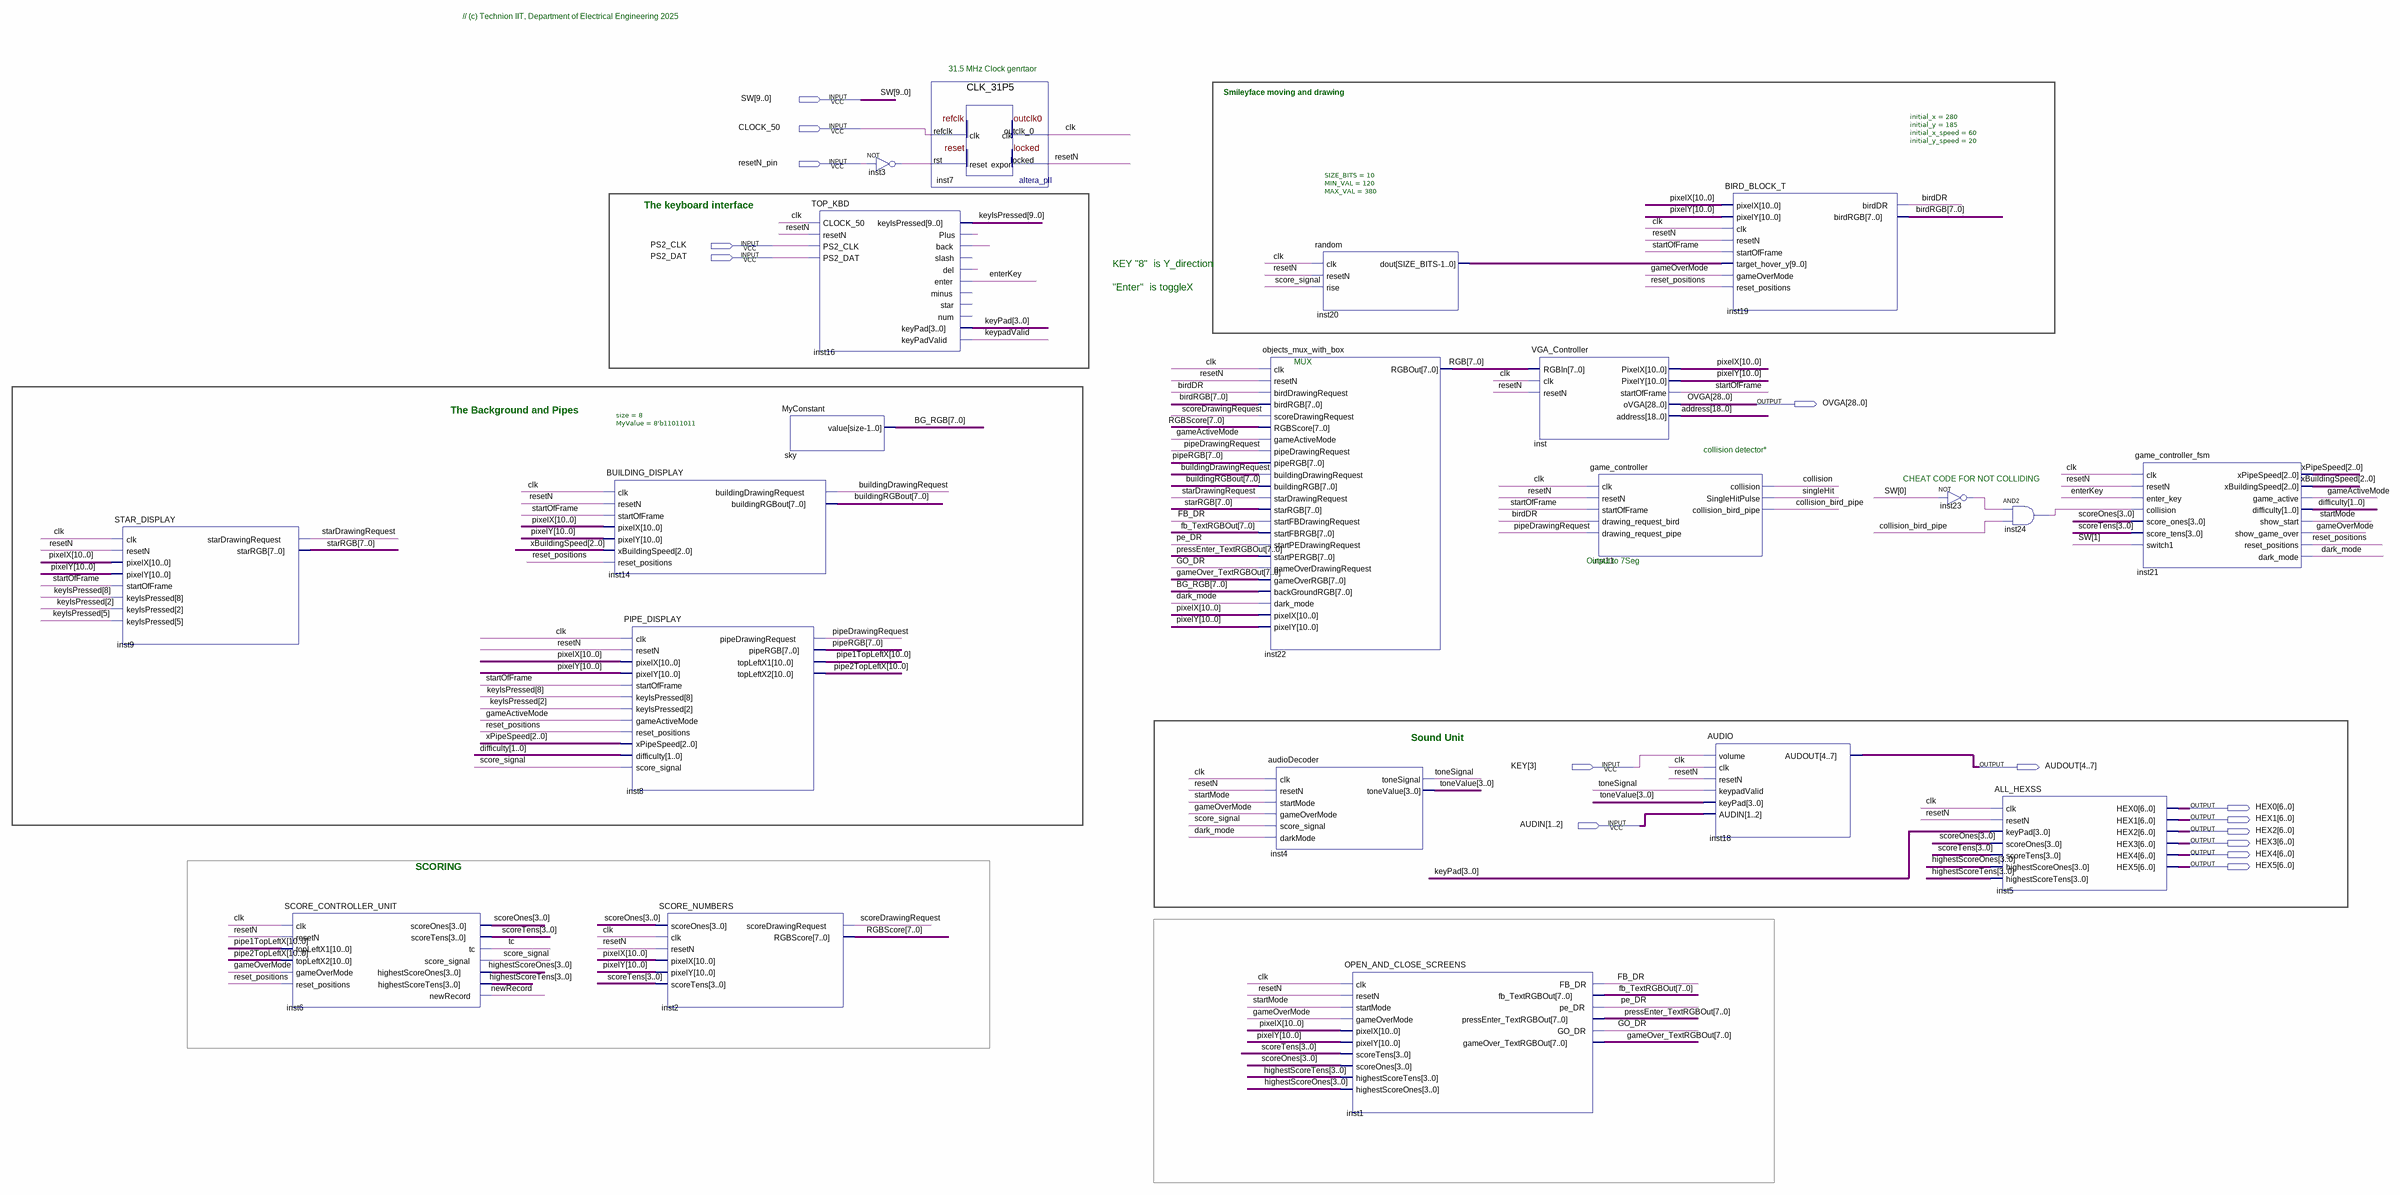
[diagram p0: schematic sheet]
// Quartus schematic TOP_VGA_DEMO.bdf as structural Verilog: 21 symbols, 15 pins
module TOP_VGA_DEMO (
  input  [9:0] SW,
  input  CLOCK_50,
  input  resetN_pin,
  input  PS2_CLK,
  input  PS2_DAT,
  input  [3:3] KEY,
  input  [1:2] AUDIN,
  output [28:0] OVGA,
  output [4:7] AUDOUT,
  output [6:0] HEX0,
  output [6:0] HEX1,
  output [6:0] HEX2,
  output [6:0] HEX3,
  output [6:0] HEX4,
  output [6:0] HEX5
);

  wire birdDR, buildingDrawingRequest, clk, collision, collision_bird_pipe, dark_mode, enterKey, FB_DR,
       gameActiveMode, gameOverMode, GO_DR, inst3_out, inst16_back, inst16_del, inst16_plus, inst23_out,
       inst24_out, keypadValid, newRecord, pe_DR, pipeDrawingRequest, reset_positions, resetN, score_signal,
       scoreDrawingRequest, singleHit, starDrawingRequest, startMode, startOfFrame, tc, toneSignal;
  wire [1:0] difficulty;
  wire [2:0] xBuildingSpeed, xPipeSpeed;
  wire [3:0] highestScoreOnes, highestScoreTens, keyPad, scoreOnes, scoreTens, toneValue;
  wire [7:0] BG_RGB, birdRGB, buildingRGBout, fb_TextRGBOut, gameOver_TextRGBOut, pipeRGB,
       pressEnter_TextRGBOut, RGB, RGBScore, starRGB;
  wire [9:0] inst20_dout, keyIsPressed;
  wire [10:0] pipe1TopLeftX, pipe2TopLeftX, pixelX, pixelY;
  wire [18:0] address;

  STAR_DISPLAY inst9 (
    .clk(clk), .resetN(resetN), .pixelX(pixelX), .pixelY(pixelY), .startOfFrame(startOfFrame),
    .keyIsPressed({keyIsPressed[8], keyIsPressed[5], keyIsPressed[2]}),
    .starDrawingRequest(starDrawingRequest), .starRGB(starRGB));
  SCORE_CONTROLLER_UNIT inst6 (
    .clk(clk), .resetN(resetN), .topLeftX1(pipe1TopLeftX), .topLeftX2(pipe2TopLeftX),
    .gameOverMode(gameOverMode), .reset_positions(reset_positions), .scoreOnes(scoreOnes),
    .scoreTens(scoreTens), .tc(tc), .score_signal(score_signal), .highestScoreOnes(highestScoreOnes),
    .highestScoreTens(highestScoreTens), .newRecord(newRecord));
  BUILDING_DISPLAY inst14 (
    .clk(clk), .resetN(resetN), .startOfFrame(startOfFrame), .pixelX(pixelX), .pixelY(pixelY),
    .xBuildingSpeed(xBuildingSpeed), .reset_positions(reset_positions),
    .buildingDrawingRequest(buildingDrawingRequest), .buildingRGBout(buildingRGBout));
  PIPE_DISPLAY inst8 (
    .clk(clk), .resetN(resetN), .pixelX(pixelX), .pixelY(pixelY), .startOfFrame(startOfFrame),
    .keyIsPressed({keyIsPressed[8], keyIsPressed[2]}), .gameActiveMode(gameActiveMode),
    .reset_positions(reset_positions), .xPipeSpeed(xPipeSpeed), .difficulty(difficulty),
    .score_signal(score_signal), .pipeDrawingRequest(pipeDrawingRequest), .pipeRGB(pipeRGB),
    .topLeftX1(pipe1TopLeftX), .topLeftX2(pipe2TopLeftX));
  SCORE_NUMBERS inst2 (
    .scoreOnes(scoreOnes), .clk(clk), .resetN(resetN), .pixelX(pixelX), .pixelY(pixelY),
    .scoreTens(scoreTens), .scoreDrawingRequest(scoreDrawingRequest), .RGBScore(RGBScore));
  MyConstant #(.size(8), .MyValue(8'b11011011)) sky (.value(BG_RGB));
  TOP_KBD inst16 (
    .CLOCK_50(clk), .resetN(resetN), .PS2_CLK(PS2_CLK), .PS2_DAT(PS2_DAT), .keyIsPressed(keyIsPressed),
    .Plus(inst16_plus), .back(inst16_back), .del(inst16_del), .enter(enterKey), .keyPad(keyPad),
    .keyPadValid(keypadValid));  // open: slash, minus, star, num
  not inst3 (inst3_out, resetN_pin);
  CLK_31P5 inst7 (.refclk(CLOCK_50), .rst(inst3_out), .outclk_0(clk), .locked(resetN));
  objects_mux_with_box inst22 (
    .clk(clk), .resetN(resetN), .birdDrawingRequest(birdDR), .birdRGB(birdRGB),
    .scoreDrawingRequest(scoreDrawingRequest), .RGBScore(RGBScore), .gameActiveMode(gameActiveMode),
    .pipeDrawingRequest(pipeDrawingRequest), .pipeRGB(pipeRGB),
    .buildingDrawingRequest(buildingDrawingRequest), .buildingRGB(buildingRGBout),
    .starDrawingRequest(starDrawingRequest), .starRGB(starRGB), .startFBDrawingRequest(FB_DR),
    .startFBRGB(fb_TextRGBOut), .startPEDrawingRequest(pe_DR), .startPERGB(pressEnter_TextRGBOut),
    .gameOverDrawingRequest(GO_DR), .gameOverRGB(gameOver_TextRGBOut), .backGroundRGB(BG_RGB),
    .dark_mode(dark_mode), .pixelX(pixelX), .pixelY(pixelY), .RGBOut(RGB));
  audioDecoder inst4 (
    .clk(clk), .resetN(resetN), .startMode(startMode), .gameOverMode(gameOverMode),
    .score_signal(score_signal), .darkMode(dark_mode), .toneSignal(toneSignal), .toneValue(toneValue));
  random #(.SIZE_BITS(10), .MIN_VAL(120), .MAX_VAL(380)) inst20 (
    .clk(clk), .resetN(resetN), .rise(score_signal), .dout(inst20_dout));
  OPEN_AND_CLOSE_SCREENS inst1 (
    .clk(clk), .resetN(resetN), .startMode(startMode), .gameOverMode(gameOverMode), .pixelX(pixelX),
    .pixelY(pixelY), .scoreTens(scoreTens), .scoreOnes(scoreOnes), .highestScoreTens(highestScoreTens),
    .highestScoreOnes(highestScoreOnes), .FB_DR(FB_DR), .fb_TextRGBOut(fb_TextRGBOut), .pe_DR(pe_DR),
    .pressEnter_TextRGBOut(pressEnter_TextRGBOut), .GO_DR(GO_DR), .gameOver_TextRGBOut(gameOver_TextRGBOut));
  VGA_Controller inst (
    .RGBIn(RGB), .clk(clk), .resetN(resetN), .PixelX(pixelX), .PixelY(pixelY), .startOfFrame(startOfFrame),
    .oVGA(OVGA), .address(address));
  game_controller inst11 (
    .clk(clk), .resetN(resetN), .startOfFrame(startOfFrame), .drawing_request_bird(birdDR),
    .drawing_request_pipe(pipeDrawingRequest), .collision(collision), .SingleHitPulse(singleHit),
    .collision_bird_pipe(collision_bird_pipe));
  BIRD_BLOCK_T #(.initial_x(280), .initial_y(185), .initial_x_speed(60), .initial_y_speed(20)) inst19 (
    .pixelX(pixelX), .pixelY(pixelY), .clk(clk), .resetN(resetN), .startOfFrame(startOfFrame),
    .target_hover_y(inst20_dout), .gameOverMode(gameOverMode), .reset_positions(reset_positions),
    .birdDR(birdDR), .birdRGB(birdRGB));
  AUDIO inst18 (
    .volume(KEY[3]), .clk(clk), .resetN(resetN), .keypadValid(toneSignal), .keyPad(toneValue), .AUDIN(AUDIN),
    .AUDOUT(AUDOUT));
  not inst23 (inst23_out, SW[0]);
  and inst24 (inst24_out, inst23_out, collision_bird_pipe);
  ALL_HEXSS inst5 (
    .clk(clk), .resetN(resetN), .keyPad(keyPad), .scoreOnes(scoreOnes), .scoreTens(scoreTens),
    .highestScoreOnes(highestScoreOnes), .highestScoreTens(highestScoreTens), .HEX0(HEX0), .HEX1(HEX1),
    .HEX2(HEX2), .HEX3(HEX3), .HEX4(HEX4), .HEX5(HEX5));
  game_controller_fsm inst21 (
    .clk(clk), .resetN(resetN), .enter_key(enterKey), .collision(inst24_out), .score_ones(scoreOnes),
    .score_tens(scoreTens), .switch1(SW[1]), .xPipeSpeed(xPipeSpeed), .xBuildingSpeed(xBuildingSpeed),
    .game_active(gameActiveMode), .difficulty(difficulty), .show_start(startMode),
    .show_game_over(gameOverMode), .reset_positions(reset_positions), .dark_mode(dark_mode));

  // Notes on the sheet:
  //   // (c) Technion IIT, Department of Electrical Engineering 2025
  //   31.5 MHz Clock genrtaor
  //   Smileyface moving and drawing
  //   The keyboard interface
  //   KEY "8"  is Y_direction
  //   "Enter"  is toggleX
  //   MUX
  //   The Background and Pipes
  //   collision detector*
  //   CHEAT CODE FOR NOT COLLIDING
  //   Output to 7Seg
  //   Sound Unit
  //   SCORING
endmodule
